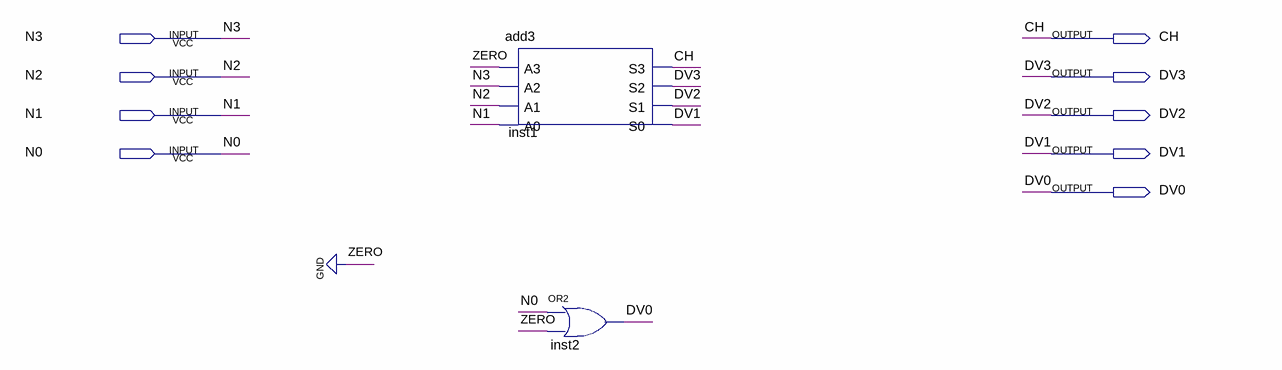
[diagram p0: schematic sheet]
// Quartus schematic bcd4.bdf as structural Verilog: 2 symbols, 9 pins
module bcd4 (
  input  N3,
  input  N2,
  input  N1,
  input  N0,
  output CH,
  output DV3,
  output DV2,
  output DV1,
  output DV0
);

  add3 inst1 (.A3(1'b0), .A2(N3), .A1(N2), .A0(N1), .S3(CH), .S2(DV3), .S1(DV2), .S0(DV1));
  or inst2 (DV0, N0, 1'b0);
endmodule
